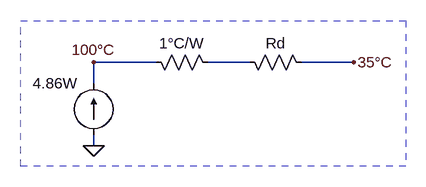
[diagram p0: schematic Overflow Abecedario - E3_ABC_Item_M_Disipador.asc]
Overflow Abecedario - E3_ABC_Item_M_Disipador.asc, the LTspice schematic file:
Version 4
SHEET 1 880 680
WIRE 160 128 64 128
WIRE 304 128 240 128
WIRE 464 128 384 128
WIRE 64 160 64 128
WIRE 64 256 64 240
FLAG 64 256 0
FLAG 464 128 35°C
FLAG 64 128 100°C
SYMBOL current 64 240 R180
WINDOW 0 24 80 Left 2
WINDOW 3 24 0 Left 2
SYMATTR InstName 4.86W
SYMATTR Value ""
SYMBOL res 144 112 M90
WINDOW 0 2 56 VBottom 2
WINDOW 3 27 56 VTop 2
SYMATTR InstName 1°C/W
SYMATTR Value ""
SYMBOL res 288 112 M90
WINDOW 0 2 56 VBottom 2
WINDOW 3 27 56 VTop 2
SYMATTR InstName Rd
SYMATTR Value ""
RECTANGLE Normal 544 288 -48 64 2

The netlist it stands for:
* Overflow Abecedario - E3_ABC_Item_M_Disipador.asc
I§4.86W 0 100°C
R§1°C/W 100°C N001
Rd N001 35°C
.backanno
.end